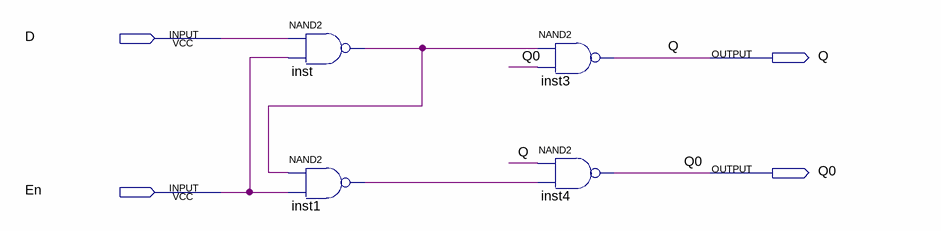
[diagram p0: schematic sheet]
// Quartus schematic FPGA_D_Latch.bdf as structural Verilog: 4 symbols, 4 pins
module FPGA_D_Latch (
  input  D,
  input  En,
  output Q,
  output Q0
);

  wire inst1_out, inst_out;

  nand inst (inst_out, D, En);
  nand inst1 (inst1_out, inst_out, En);
  nand inst3 (Q, inst_out, Q0);
  nand inst4 (Q0, Q, inst1_out);
endmodule
